# Altium schematic sheet MOSDriver.SchDoc
size A3; SheetNumber: 2; SheetTotal: 6
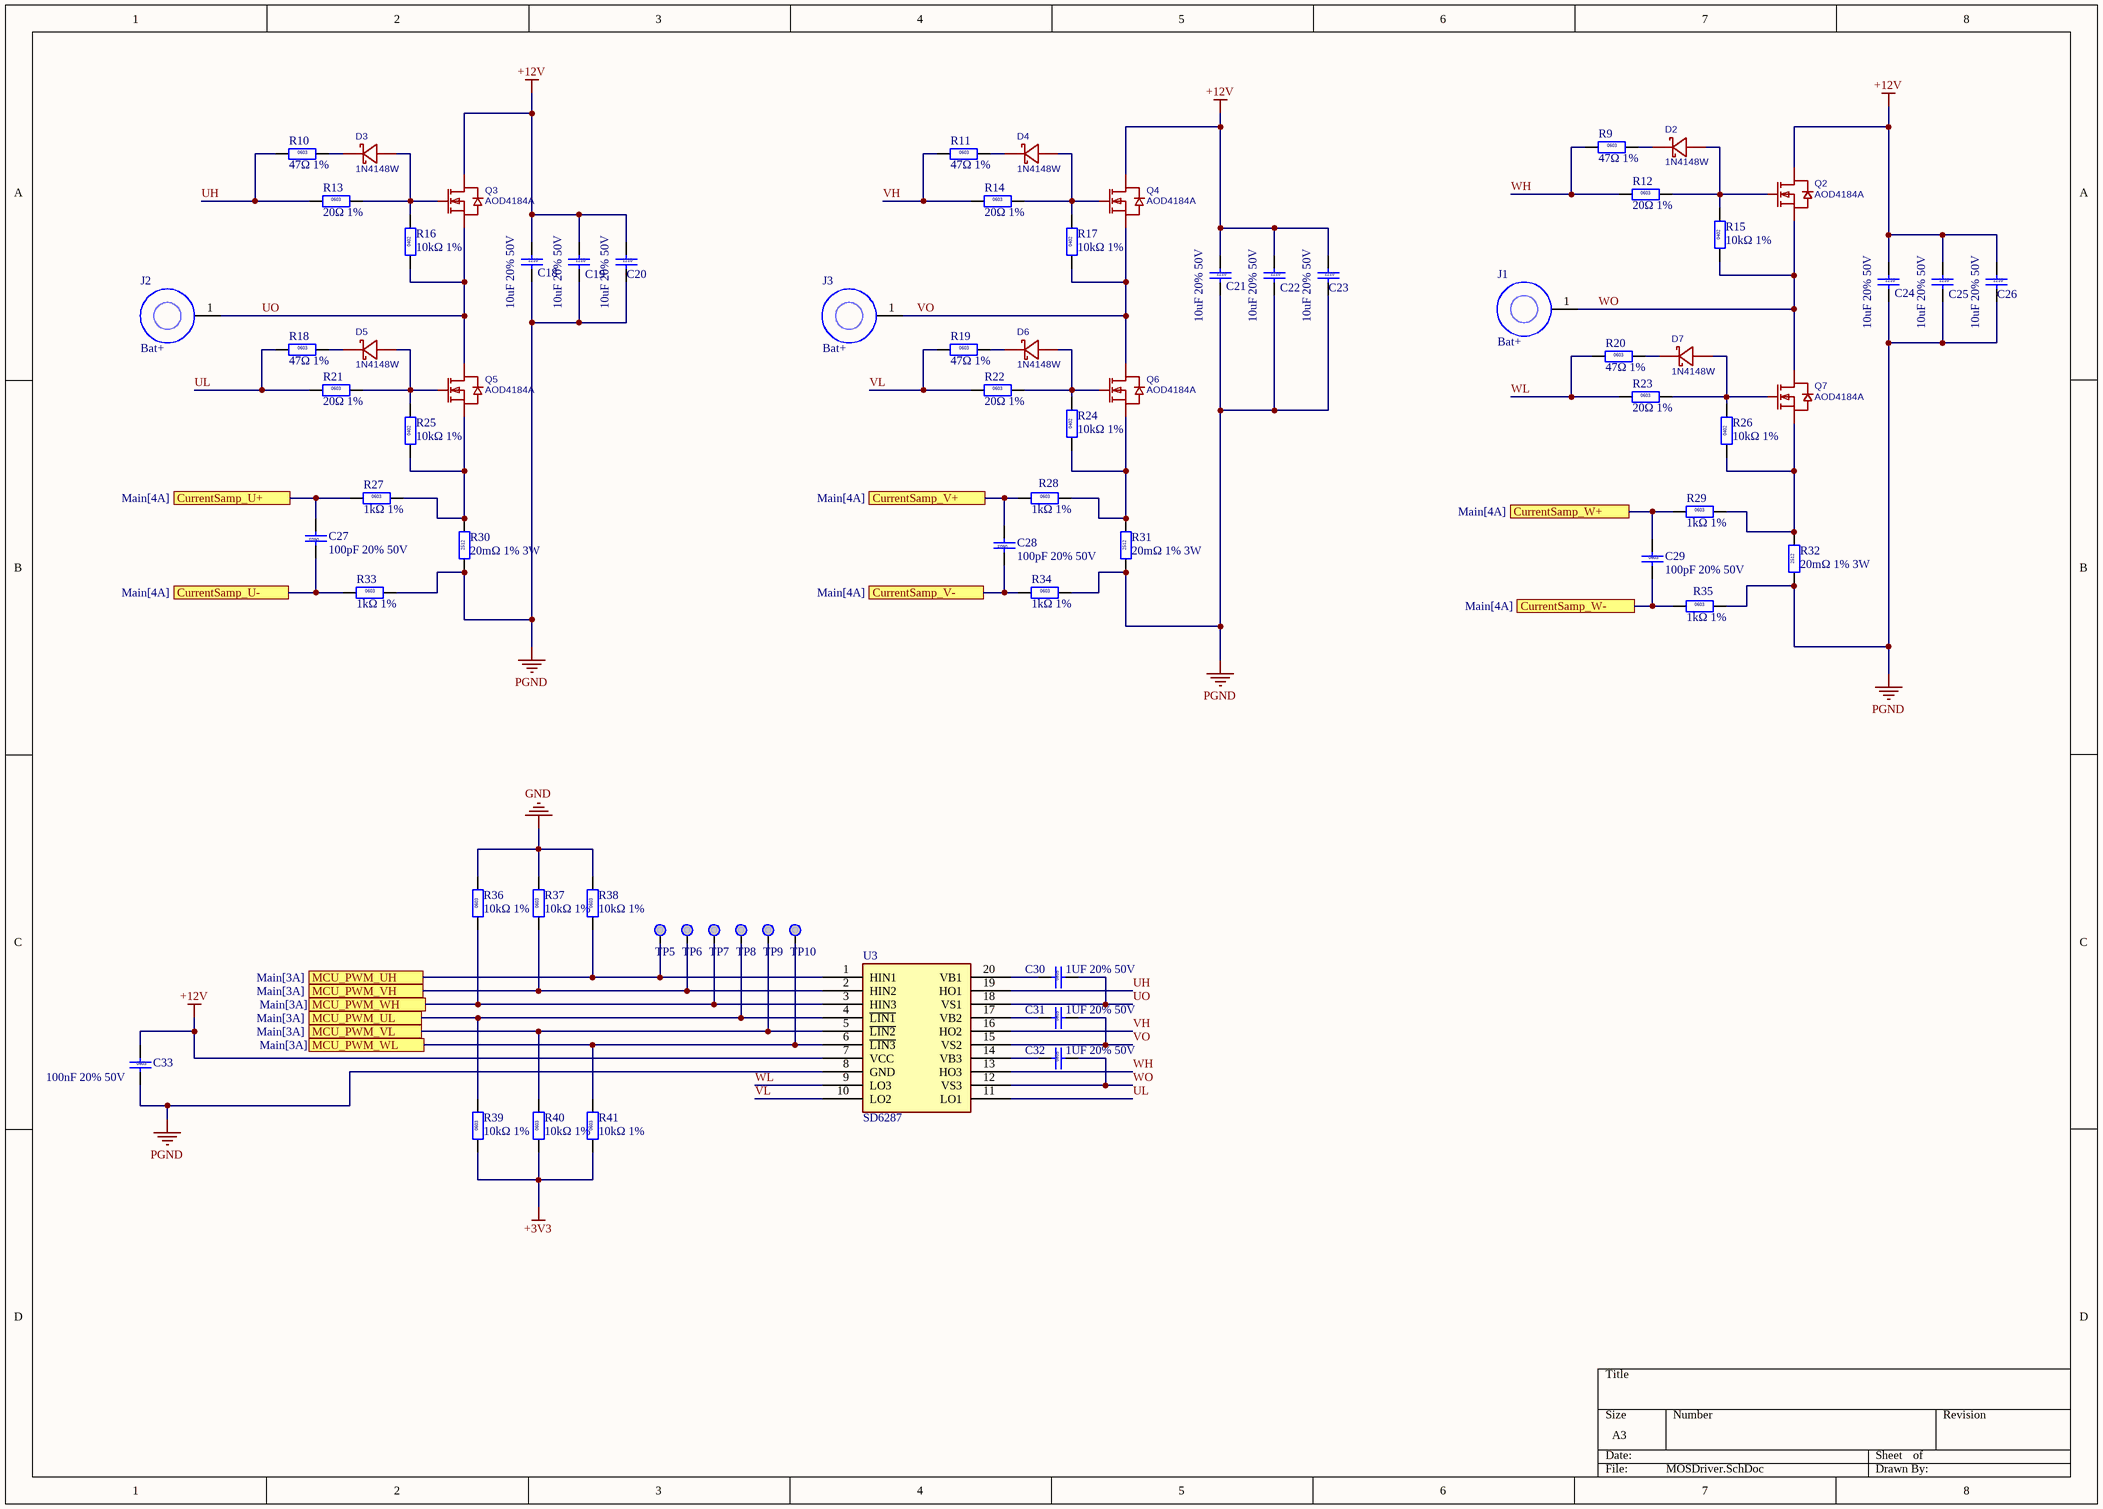
[diagram p0: MOSDriver.SchDoc]

## Parts
C18  10uF 20% 50V  [C1210]
C19  10uF 20% 50V  [C1210]
C20  10uF 20% 50V  [C1210]
C21  10uF 20% 50V  [C1210]
C22  10uF 20% 50V  [C1210]
C23  10uF 20% 50V  [C1210]
C24  10uF 20% 50V  [C1210]
C25  10uF 20% 50V  [C1210]
C26  10uF 20% 50V  [C1210]
C27  100pF 20% 50V  [C0603]
C28  100pF 20% 50V  [C0603]
C29  100pF 20% 50V  [C0603]
C30  1UF 20% 50V  [C0805]
C31  1UF 20% 50V  [C0805]
C32  1UF 20% 50V  [C0805]
C33  100nF 20% 50V  [C0603]
D2  1N4148W  [SOD-123_L2.7-W1.6-LS3.7-FD]
D3  1N4148W  [SOD-123_L2.7-W1.6-LS3.7-FD]
D4  1N4148W  [SOD-123_L2.7-W1.6-LS3.7-FD]
D5  1N4148W  [SOD-123_L2.7-W1.6-LS3.7-FD]
D6  1N4148W  [SOD-123_L2.7-W1.6-LS3.7-FD]
D7  1N4148W  [SOD-123_L2.7-W1.6-LS3.7-FD]
J1  Bat+  [VIAD1.8M1.3MM]
J2  Bat+  [VIAD1.8M1.3MM]
J3  Bat+  [VIAD1.8M1.3MM]
Q2  AOD4184A  [TO-252-2_L6.6-W6.1-P4.57-LS9.9-TL-CW]
Q3  AOD4184A  [TO-252-2_L6.6-W6.1-P4.57-LS9.9-TL-CW]
Q4  AOD4184A  [TO-252-2_L6.6-W6.1-P4.57-LS9.9-TL-CW]
Q5  AOD4184A  [TO-252-2_L6.6-W6.1-P4.57-LS9.9-TL-CW]
Q6  AOD4184A  [TO-252-2_L6.6-W6.1-P4.57-LS9.9-TL-CW]
Q7  AOD4184A  [TO-252-2_L6.6-W6.1-P4.57-LS9.9-TL-CW]
R9  47Ω 1%  [R0603]
R10  47Ω 1%  [R0603]
R11  47Ω 1%  [R0603]
R12  20Ω 1%  [R0603]
R13  20Ω 1%  [R0603]
R14  20Ω 1%  [R0603]
R15  10kΩ 1%  [R0402]
R16  10kΩ 1%  [R0402]
R17  10kΩ 1%  [R0402]
R18  47Ω 1%  [R0603]
R19  47Ω 1%  [R0603]
R20  47Ω 1%  [R0603]
R21  20Ω 1%  [R0603]
R22  20Ω 1%  [R0603]
R23  20Ω 1%  [R0603]
R24  10kΩ 1%  [R0402]
R25  10kΩ 1%  [R0402]
R26  10kΩ 1%  [R0402]
R27  1kΩ 1%  [R0603]
R28  1kΩ 1%  [R0603]
R29  1kΩ 1%  [R0603]
R30  20mΩ 1% 3W  [R2512]
R31  20mΩ 1% 3W  [R2512]
R32  20mΩ 1% 3W  [R2512]
R33  1kΩ 1%  [R0603]
R34  1kΩ 1%  [R0603]
R35  1kΩ 1%  [R0603]
R36  10kΩ 1%  [R0603]
R37  10kΩ 1%  [R0603]
R38  10kΩ 1%  [R0603]
R39  10kΩ 1%  [R0603]
R40  10kΩ 1%  [R0603]
R41  10kΩ 1%  [R0603]
TP5  TestPoint  [TP-40]  (value not drawn)  (no BOM)
TP6  TestPoint  [TP-40]  (value not drawn)  (no BOM)
TP7  TestPoint  [TP-40]  (value not drawn)  (no BOM)
TP8  TestPoint  [TP-40]  (value not drawn)  (no BOM)
TP9  TestPoint  [TP-40]  (value not drawn)  (no BOM)
TP10  TestPoint  [TP-40]  (value not drawn)  (no BOM)
U3  SD6287  [TSSOP-20]

## Ports
CurrentSamp_U+ (see Main[4A]), CurrentSamp_U- (see Main[4A]), CurrentSamp_V+ (see Main[4A]), CurrentSamp_V- (see Main[4A]), CurrentSamp_W+ (see Main[4A]), CurrentSamp_W- (see Main[4A]), MCU_PWM_UH (see Main[3A]), MCU_PWM_UL (see Main[3A]), MCU_PWM_VH (see Main[3A]), MCU_PWM_VL (see Main[3A]), MCU_PWM_WH (see Main[3A]), MCU_PWM_WL (see Main[3A])

## Nets
+3V3: R39.1 R40.1 R41.1
+12V: C18.1 C19.1 C20.1 C21.1 C22.1 C23.1 C24.1 C25.1 C26.1 C33.1 Q2.2(D) Q3.2(D) Q4.2(D) U3.7(VCC)
GND: R36.2 R37.2 R38.2
PGND: C18.2 C19.2 C20.2 C21.2 C22.2 C23.2 C24.2 C25.2 C26.2 C33.2 R30.1 R31.1 R32.1 R33.2 R34.2 R35.2 U3.8(GND)
CurrentSamp_U+: C27.2 R27.1 ; port CurrentSamp_U+
CurrentSamp_U-: C27.1 R33.1 ; port CurrentSamp_U-
CurrentSamp_V+: C28.2 R28.1 ; port CurrentSamp_V+
CurrentSamp_V-: C28.1 R34.1 ; port CurrentSamp_V-
CurrentSamp_W+: C29.1 R29.1 ; port CurrentSamp_W+
CurrentSamp_W-: C29.2 R35.1 ; port CurrentSamp_W-
MCU_PWM_UH: R38.1 TP5.1 U3.1(HIN1) ; port MCU_PWM_UH
MCU_PWM_UL: R39.2 TP8.1 U3.4(~{LIN1}) ; port MCU_PWM_UL
MCU_PWM_VH: R37.1 TP6.1 U3.2(HIN2) ; port MCU_PWM_VH
MCU_PWM_VL: R40.2 TP9.1 U3.5(~{LIN2}) ; port MCU_PWM_VL
MCU_PWM_WH: R36.1 TP7.1 U3.3(HIN3) ; port MCU_PWM_WH
MCU_PWM_WL: R41.2 TP10.1 U3.6(~{LIN3}) ; port MCU_PWM_WL
UH: R10.1 R13.1 U3.19(HO1)
UL: R18.1 R21.1 U3.11(LO1)
UO: C30.2 J2.1 Q3.3(S) Q5.2(D) R16.1 U3.18(VS1)
VH: R11.1 R14.1 U3.16(HO2)
VL: R19.1 R22.1 U3.10(LO2)
VO: C31.2 J3.1 Q4.3(S) Q6.2(D) R17.1 U3.15(VS2)
WH: R9.1 R12.1 U3.13(HO3)
WL: R20.1 R23.1 U3.9(LO3)
WO: C32.2 J1.1 Q2.3(S) Q7.2(D) R15.1 U3.12(VS3)
NetC30_1: C30.1 U3.20(VB1)
NetC31_1: C31.1 U3.17(VB2)
NetC32_1: C32.1 U3.14(VB3)
NetD2_1: D2.1(A) Q2.1(G) R12.2 R15.2
NetD2_2: D2.2(K) R9.2
NetD3_1: D3.1(A) Q3.1(G) R13.2 R16.2
NetD3_2: D3.2(K) R10.2
NetD4_1: D4.1(A) Q4.1(G) R14.2 R17.2
NetD4_2: D4.2(K) R11.2
NetD5_1: D5.1(A) Q5.1(G) R21.2 R25.2
NetD5_2: D5.2(K) R18.2
NetD6_1: D6.1(A) Q6.1(G) R22.2 R24.2
NetD6_2: D6.2(K) R19.2
NetD7_1: D7.1(A) Q7.1(G) R23.2 R26.2
NetD7_2: D7.2(K) R20.2
NetQ5_3: Q5.3(S) R25.1 R27.2 R30.2
NetQ6_3: Q6.3(S) R24.1 R28.2 R31.2
NetQ7_3: Q7.3(S) R26.1 R29.2 R32.2

## Notes on the sheet
- (in symbol C0603) 0603
- (in symbol C0805) 0805
- (in symbol R0603) 0603
- (in symbol R2512) 2512

## Library data of the parts
C18-C26 = C1210: 贴片电容; Package: 1210
C27-C29 C33 = C0603: 贴片电容; Package: C0603
C30-C32 = C0805: 贴片电容; Package: C0805
D2-D7 = 1N4148W_C7420318: 二极管配置:独立式;整流电流:150mA;直流反向耐压(Vr):100V;正向压降(Vf):1.25V@150mA;反向恢复时间(Trr):4ns;; Manufacturer: R+O(宏嘉诚); AddInBom: yes; ModelId: 5054d9b7be8b429dad093a54b517b4dd聨0819f05c4eef4c71ace90d822a990e87; ModelTransform: 145.669,61.024,0,0,0,0,0,0,0; Diode Configuration: 独立式; Pd - Power Dissipation: 400mW; Current - Rectified: 150mA; Voltage - DC Reverse(Vr): 100V; Non-Repetitive Peak Forward Surge Current: 2A; Reverse Leakage Current (Ir): 1uA@75V; Reverse Recovery Time (trr): 4ns; Operating Junction Temperature Range: -55℃~+150℃; Symbol: 1N4148W_C7420318; Device: 1N4148W_C7420318; LCSC Part Name: 100V 150mA; SupplierPart: C7420318; ManufacturerPart: 1N4148W; Supplier Footprint: SOD-123; JLCPCB Part Class: Extended Part; Datasheet: https://item.szlcsc.com/datasheet/1N4148W/8397140.html; Supplier: LCSC; ConvertToPcb: yes; FootprintName: SOD-123_L2.7-W1.6-LS3.7-FD; ModelName: SOD-123_L2.7-W1.6-LS3.7-FD; Voltage - Forward(Vf@If): 1.25V@150mA
J1-J3 = VIAHole: 通用过孔; Notepad: *
Q2-Q7 = AOD4184A: 数量:1个N沟道;漏源电压(Vdss):40V;连续漏极电流(Id):13A；50A;导通电阻(RDS(on)):7mΩ@10V;耗散功率(Pd):2.3W；50W;阈值电压(Vgs(th)):2.6V;; Manufacturer: AOS; AddInBom: yes; ModelId: ce57f84d66384067af8a68020b6de06d聨0819f05c4eef4c71ace90d822a990e87; ModelName: TO-252-2L-3P_L6.6-W6.1-H2.3-LS10.1-P4.6; ModelTransform: 259.842,390.52442,0,270,0,0,38.027,-0.598,0; Number: 1个N沟道; Drain to Source Voltage: 40V; Gate Threshold Voltage (Vgs(th)): 2.6V; Gate Charge(Qg): 33nC@10V; Input Capacitance(Ciss): 1.8nF; Reverse Transfer Capacitance (Crss@Vds): 135pF; Type: N沟道; Output Capacitance(Coss): 215pF; Vgs: ±20V; Symbol: AOD4184A; Device: AOD4184A; LCSC Part Name: 1个N沟道 耐压:40V 电流:13A 50A; SupplierPart: C99124; ManufacturerPart: AOD4184A; Supplier Footprint: TO-252; JLCPCB Part Class: Extended Part; Datasheet: https://item.szlcsc.com/datasheet/AOD4184A/100337.html; Supplier: LCSC; ConvertToPcb: yes; FootprintName: TO-252-2_L6.6-W6.1-P4.57-LS9.9-TL-CW; Current - Continuous Drain(Id): 13A；50A; RDS(on): 7mΩ@10V; Pd - Power Dissipation: 2.3W；50W; Operating Temperature: -55℃~+175℃; Configuration: -
R9-R14 R18-R23 R27-R29 R33-R41 = R0603: 贴片电阻; Package: R0603
R15-R17 R24-R26 = R0402: 贴片电阻; Package: 0402
R30-R32 = R2512: 贴片电阻; Package: R2512
TP5-TP10 = TestPoint: Test Point
U3 = SD6287: 三相独立半桥驱动芯片; Notepad: 扩展库; Package: TSSOP-20_4.4x6.5x0.65P